# Altium schematic sheet USB,TFT LCD,touchscreen,audio amplifier.SchDoc
size A4; SheetNumber: 4; SheetTotal: 18
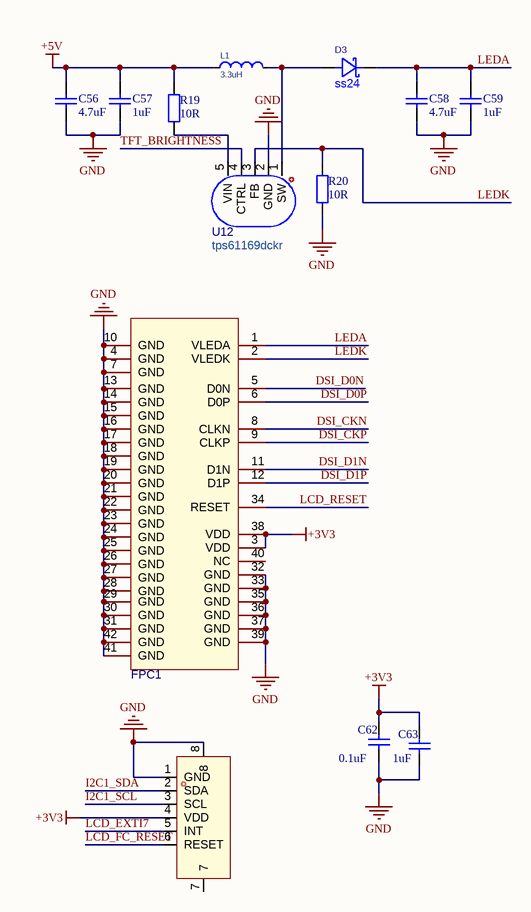
[diagram p0: USB,TFT LCD,touchscreen,audio amplifier.SchDoc]

## Parts
C56  4.7uF  [C0603]
C57  1uF  [C0603]
C58  4.7uF  [C0603]
C59  1uF  [C0603]
C62  0.1uF  [C0603]
C63  1uF  [C0603]
D3  ss24  [SMA_L4.3-W2.6-LS5.0-FD]
FPC1  afc01-s40fca-00  [FPC-SMD_AFC01-S40FCA-00]  (value not drawn)
FPC2  fpc-05f-6ph20  [FPC-SMD_6P-P0.50_XUNPU_FPC-05F-6PH20]  (value not drawn)
L1  3.3uH  [IND-SMD_L3.9-W3.9-1]
R19  10R  [R0603]
R20  10R  [R0603]
U12  tps61169dckr  [SC-70-5_L2.1-W1.3-P0.65-LS2.1-BR]

## Nets
+3V3: C62.1 C63.1 FPC1.3(VDD) FPC1.38(VDD) FPC2.4(VDD)
+5V: C56.2 C57.2 L1.1 R19.2
GND: C56.1 C57.1 C58.1 C59.1 C62.2 C63.2 FPC1.4(GND) FPC1.7(GND) FPC1.10(GND) FPC1.13(GND) FPC1.14(GND) FPC1.15(GND) FPC1.16(GND) FPC1.17(GND) FPC1.18(GND) FPC1.19(GND) FPC1.20(GND) FPC1.21(GND) FPC1.22(GND) FPC1.23(GND) FPC1.24(GND) FPC1.25(GND) FPC1.26(GND) FPC1.27(GND) FPC1.28(GND) FPC1.29(GND) FPC1.30(GND) FPC1.31(GND) FPC1.32(GND) FPC1.33(GND) FPC1.35(GND) FPC1.36(GND) FPC1.37(GND) FPC1.39(GND) FPC1.41(GND) FPC1.42(GND) FPC2.1(GND) FPC2.8 R20.1 U12.2(GND)
DSI_CKN: FPC1.8(CLKN)
DSI_CKP: FPC1.9(CLKP)
DSI_D0N: FPC1.5(D0N)
DSI_D0P: FPC1.6(D0P)
DSI_D1N: FPC1.11(D1N)
DSI_D1P: FPC1.12(D1P)
I2C1_SCL: FPC2.3(SCL)
I2C1_SDA: FPC2.2(SDA)
LCD_EXTI7: FPC2.5(INT)
LCD_FC_RESET: FPC2.6(RESET)
LCD_RESET: FPC1.34(RESET)
LEDA: C58.2 C59.2 D3.2(K) FPC1.1(VLEDA)
LEDK: FPC1.2(VLEDK) R20.2 U12.3(FB)
TFT_BRIGHTNESS: U12.4(CTRL)
NetD3_1: D3.1(A) L1.2 U12.1(SW)
NetR19_1: R19.1 U12.5(VIN)

Not connected (* = marked no-connect by the designer): FPC1 40(NC); FPC2 7

## Library data of the parts
C56-C59 = C0603_1: Capacitor; Value: 104; Published: 8-Jun-2000; LatestRevisionDate: 17-Jul-2002; LatestRevisionNote: Re-released for DXP Platform.; Publisher: Altium Limited
C62 C63 = C0603: CAP CER 0.1UF 50V, 10% X7R 0603; Value: 104; Published: 8-Jun-2000; LatestRevisionDate: 17-Jul-2002; LatestRevisionNote: Re-released for DXP Platform.; Publisher: Altium Limited
D3 = ss34_c7420365: 二极管配置:独立式;正向压降(Vf):550mV@3A;直流反向耐压(Vr):40V;整流电流:3A;; Manufacturer: R+O(宏嘉诚); ManufacturerPart: SS34; AddInBom: yes; ModelId: 7e24bebe6cd74171ae8c9de6fc5b78aa; ModelTransform: 198.4248,103.5431,0,180,0,0,-0.001,0,0; Diode Configuration: 独立式; Voltage - DC Reverse(Vr): 40V; Current - Rectified: 3A; Reverse Leakage Current (Ir): 200uA@40V; Symbol: SS34_C7420365; LCSC Part Name: 电压:40V 电流:3A; SupplierPart: C7420365; Supplier Footprint: SMA(DO-214AC); JLCPCB Part Class: Extended Part; Datasheet: https://item.szlcsc.com/datasheet/SS34/8397187.html; Supplier: LCSC; ConvertToPcb: yes; FootprintName: SMA_L4.3-W2.6-LS5.0-FD; ModelName: SMA_L4.3-W2.6-LS5.0-FD; Voltage - Forward(Vf@If): 550mV@3A
FPC1 = afc01-s40fca-00: 锁定特性:翻盖式;触点类型:下接;触点数量:40P;间距:0.5mm;安装方式:卧贴;工作温度:-45℃~+85℃;; Manufacturer: JS(钜硕电子); AddInBom: yes; ModelId: 458e5f3c71f743329f5584acd337d3c8; ModelTransform: 961.0217,240.157,0,0,0,0,0,-52.441,0; Locking Feature: 翻盖式; Number of Contacts: 40P; Pitch: 0.5mm; FFC, FCB Thickness: 0.3mm; Rated Voltage (Max): 50V; Current Rating (Max): 500mA; Symbol: AFC01-S40FCA-00; LCSC Part Name: 翻盖式 下接 P数:40P 间距:0.5mm; SupplierPart: C262674; ManufacturerPart: AFC01-S40FCA-00; Supplier Footprint: SMD,P=0.5mm,卧贴; JLCPCB Part Class: Extended Part; Datasheet: https://item.szlcsc.com/datasheet/AFC01-S40FCA-00/253933.html; Supplier: LCSC; ConvertToPcb: yes; FootprintName: FPC-SMD_AFC01-S40FCA-00; ModelName: FPC-SMD_AFC01-S40FCA-00; Contact Type: 下接; Mounting Type: 卧贴; Height Above Board: 2mm; Contact Material: 铜合金; Contact Plating: 锡; Operating Temperature: -45℃~+85℃
FPC2 = fpc-05f-6ph20_1: 锁定特性:翻盖式;触点类型:下接;触点数量:6P;间距:0.5mm;安装方式:卧贴;工作温度:-25℃~+85℃;; Manufacturer: XUNPU(讯普); AddInBom: yes; ModelId: f0153d283bb647ab8cc6ddf5c8ee15be; ModelTransform: 291.338,220.472,0,0,0,0,-0.001,-45.276,0; Locking Feature: 翻盖式; Number of Contacts: 6P; Pitch: 0.5mm; FFC, FCB Thickness: 0.3mm; Rated Voltage (Max): 50V; Current Rating (Max): 500mA; Symbol: FPC-05F-6PH20; LCSC Part Name: 翻盖式 下接 P数:6P 间距:0.5mm; SupplierPart: C2856796; ManufacturerPart: FPC-05F-6PH20; Supplier Footprint: SMD,P=0.5mm,卧贴; JLCPCB Part Class: Extended Part; Datasheet: https://item.szlcsc.com/datasheet/FPC-05F-6PH20/3056894.html; Supplier: LCSC; ConvertToPcb: yes; FootprintName: FPC-SMD_6P-P0.50_XUNPU_FPC-05F-6PH20; ModelName: FPC-SMD_6P-P0.50_XUNPU_FPC-05F-6PH20; Contact Type: 下接; Mounting Type: 卧贴; Height Above Board: 2mm; Contact Material: 磷青铜; Contact Plating: 锡; Operating Temperature: -25℃~+85℃
L1 = LPS4018-472MRC: 0805  INDUCTOR MULTILAYER; Manufacturer: TDK; Symbol: MLZ2012A3R3WT000; Add into BOM: yes; Tolerance: ±20%; Saturation Current (Isat): 200mA; DC Resistance (DCR): 340mΩ; Frequency - Self Resonant: 90MHz; Device: MLZ2012A3R3WT000; LCSC Part Name: 3.3uH ±20% 200mA; Supplier Part: C383399; Manufacturer Part: MLZ2012A3R3WT000; Supplier Footprint: 0805; JLCPCB Part Class: Extended Part; Datasheet: https://atta.szlcsc.com/upload/public/pdf/source/20200324/C383404_6F95903E86AEDF16368640ABB3D81E0E.pdf; Supplier: LCSC; Convert to PCB: yes; Value: 3.3uH; Rated Current: -; Q @ Freq: -; Ratings: -
R19 R20 = R0603: Resistor; Published: 8-Jun-2000; LatestRevisionDate: 17-Jul-2002; LatestRevisionNote: Re-released for DXP Platform.; Publisher: Altium Limited
U12 = tps61169dckr: 类型:DC-DC;工作电压(DC):2.7V~5.5V;开关频率:1.2MHz;通道数:1;输出电压:2.7V~38V;输出电流:-;调光:PWM;拓扑结构:升压;; Manufacturer: TI(德州仪器); AddInBom: yes; ModelId: e25de95d33824a3dab7086d8b5286abf; ModelName: SC-70-5_L2.1-W1.3-H1.0-LS2.1-P0.65; ModelTransform: 82.677,78.74,0,180,0,0,0,0,0; Frequency - Switching: 1.2MHz; Number of Channels: 1; Dimming: PWM; Topology: 升压; Switch Tube (Built-In/External): 内置; Symbol: TPS61169DCKR; LCSC Part Name: 采用PWM控制的38V高电流升压WLED驱动器; SupplierPart: C71045; ManufacturerPart: TPS61169DCKR; Supplier Footprint: SC-70-5; JLCPCB Part Class: Extended Part; Datasheet: https://www.ti.com/cn/lit/gpn/tps61169; Supplier: LCSC; ConvertToPcb: yes; FootprintName: SC-70-5_L2.1-W1.3-P0.65-LS2.1-BR; Type: DC-DC; Voltage - Input(DC): 2.7V~5.5V; Output Voltage: 2.7V~38V; Output Current: -; Features: 过温保护(OTP); Voltage - Input(AC): -; Operating temperature: -40℃~+125℃; Constant Current Accuracy: -